# Altium schematic sheet TPS25750D.SchDoc
size A2; Date: Not shown in title block; ApprovedBy: Not shown in title block; CheckedBy: Not shown in title block; Author: Not shown in title block; CompanyName: Not shown in title block; Engineer: Not shown in title block; Organization: Not shown in title block; Address1: Not shown in title block; Address2: Not shown in title block; Address3: Not shown in title block; Address4: Not shown in title block; DocumentNumber: 2; Revision: Use project parameter SCH_Rev; SheetNumber: 2; SheetTotal: 3; PageSetup: Record=PageOptions|CenterHorizontal=True|CenterVertical=True|PrintScale=1.00|XCorrection=1.00|YCorrection=1.00|PrintKind=0|BorderSize=5000000|LeftOffset=0|BottomOffset=0|Orientation=2|PaperLength=1000|PaperWidth=1000|Scale=100|PaperSource=15|PrintQuality=600|MediaType=1|DitherType=10|PaperKind=Letter|PrintScaleMode=1; CurrentTime: Not shown in title block; CurrentDate: Not shown in title block; Time: Not shown in title block; DocumentFullPathAndName: Not shown in title block; DocumentName: Not shown in title block; ModifiedDate: Not shown in title block; ImagePath: Not shown in title block
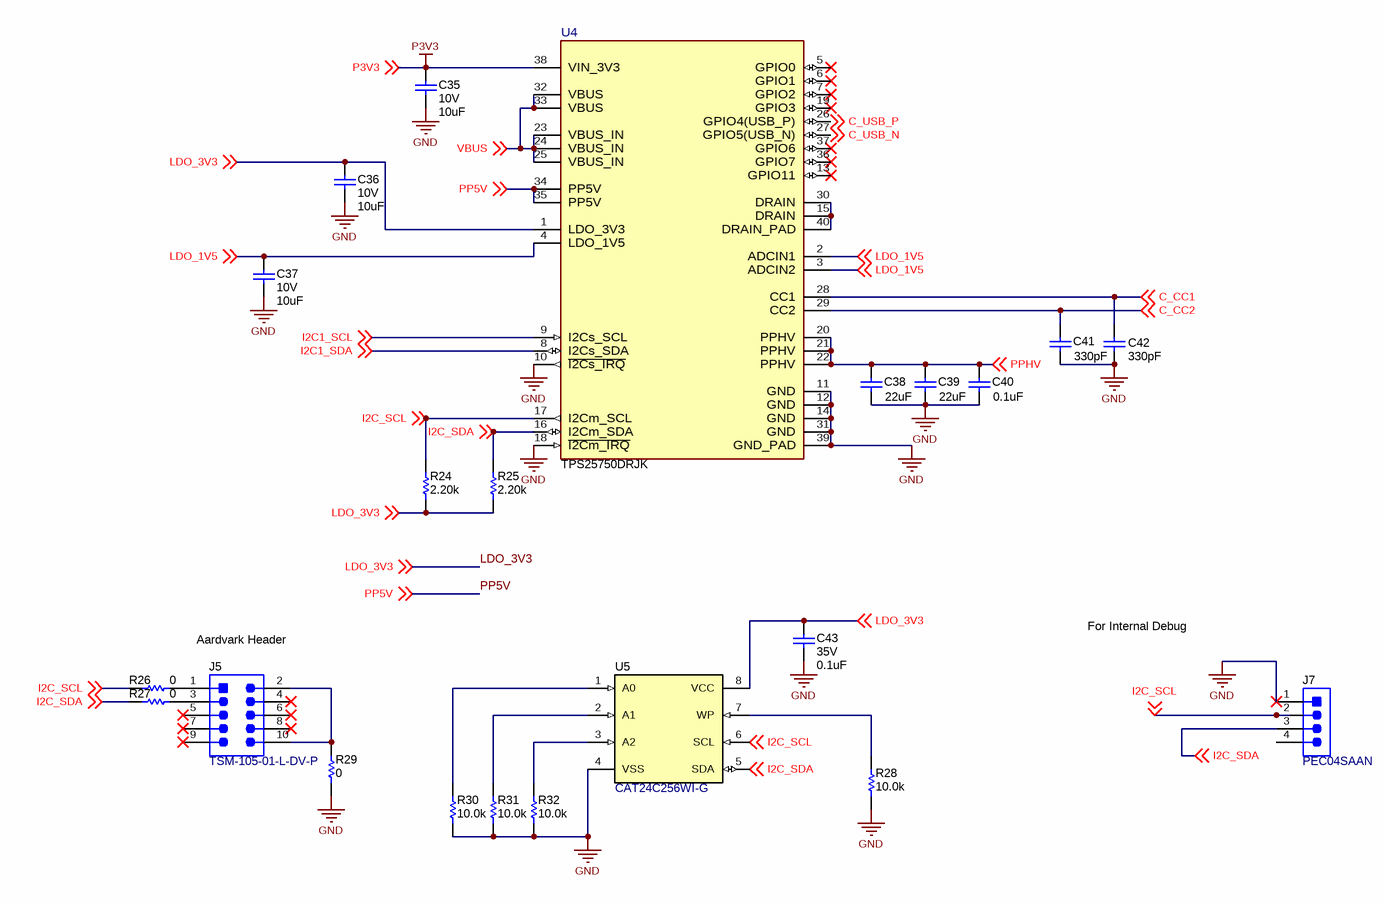
[diagram p0: TPS25750D.SchDoc]

## Parts
C35  VDC_V: 10V  ValueDisplayed: 10uF  [0402_070]  (hidden comment: CL05A106MP5NUNC)
C36  VDC_V: 10V  ValueDisplayed: 10uF  [0402_070]  (hidden comment: CL05A106MP5NUNC)
C37  VDC_V: 10V  ValueDisplayed: 10uF  [0402_070]  (hidden comment: CL05A106MP5NUNC)
C38  ValueDisplayed: 22uF  [0805_HV]  (hidden comment: C2012X5R1V226M125AC)
C39  ValueDisplayed: 22uF  [0805_HV]  (hidden comment: C2012X5R1V226M125AC)
C40  ValueDisplayed: 0.1uF  [0402]  (hidden comment: GMK105BJ104KV-F)
C41  ValueDisplayed: 330pF  [0201_033]  (hidden comment: GRM033R71H331KA12D)
C42  ValueDisplayed: 330pF  [0201_033]  (hidden comment: GRM033R71H331KA12D)
C43  VDC_V: 35V  ValueDisplayed: 0.1uF  [0402]  (hidden comment: GMK105BJ104KV-F)
J5  TSM-105-01-L-DV-P  [Samtec_TSM-105-01-x-DV]
J7  PEC04SAAN  [SULLINS_PEC04SAAN]
R24  ValueDisplayed: 2.20k  [0201]  (hidden comment: CRCW02012K20FKED)
R25  ValueDisplayed: 2.20k  [0201]  (hidden comment: CRCW02012K20FKED)
R26  ValueDisplayed: 0  [0201]  (hidden comment: CRCW02010000Z0ED)
R27  ValueDisplayed: 0  [0201]  (hidden comment: CRCW02010000Z0ED)
R28  ValueDisplayed: 10.0k  [0201]  (hidden comment: CRCW020110K0FKED)
R29  ValueDisplayed: 0  [0201]  (hidden comment: CRCW02010000Z0ED)
R30  ValueDisplayed: 10.0k  [0201]  (hidden comment: CRCW020110K0FKED)
R31  ValueDisplayed: 10.0k  [0201]  (hidden comment: CRCW020110K0FKED)
R32  ValueDisplayed: 10.0k  [0201]  (hidden comment: CRCW020110K0FKED)
U4  TPS25750DRJK  [RJK0038B-C01-MFG]
U5  CAT24C256WI-G  [SOIC-8]

## Nets
GND: C35.2 C36.2 C37.2 C38.2 C39.2 C40.2 C41.2 C42.2 C43.2 J7.1 R28.1 R29.1 R30.1 R31.1 R32.1 U4.10(~{I2Cs_IRQ}) U4.11(GND) U4.12(GND) U4.14(GND) U4.18(~{I2Cm_IRQ}) U4.31(GND) U4.39(GND_PAD) U5.4(VSS)
P3V3: C35.1 U4.38(VIN_3V3) ; off-sheet P3V3
C_CC1: C42.1 U4.28(CC1) ; off-sheet C_CC1
C_CC2: C41.1 U4.29(CC2) ; off-sheet C_CC2
C_USB_N: U4.27(GPIO5(USB_N)) ; off-sheet C_USB_N
C_USB_P: U4.26(GPIO4(USB_P)) ; off-sheet C_USB_P
I2C1_SCL: U4.9(I2Cs_SCL) ; off-sheet I2C1_SCL
I2C1_SDA: U4.8(I2Cs_SDA) ; off-sheet I2C1_SDA
I2C_SCL: J7.2 R24.2 R26.1 U4.17(I2Cm_SCL) U5.6(SCL) ; off-sheet I2C_SCL
I2C_SDA: J7.3 R25.2 R27.1 U4.16(I2Cm_SDA) U5.5(SDA) ; off-sheet I2C_SDA
LDO_1V5: C37.1 U4.2(ADCIN1) U4.3(ADCIN2) U4.4(LDO_1V5) ; off-sheet LDO_1V5
LDO_3V3: C36.1 C43.1 R24.1 R25.1 U4.1(LDO_3V3) U5.8(VCC) ; off-sheet LDO_3V3
PP5V: U4.34(PP5V) U4.35(PP5V) ; off-sheet PP5V
PPHV: C38.1 C39.1 C40.1 U4.20(PPHV) U4.21(PPHV) U4.22(PPHV) ; off-sheet PPHV
VBUS: U4.23(VBUS_IN) U4.24(VBUS_IN) U4.25(VBUS_IN) U4.32(VBUS) U4.33(VBUS) ; off-sheet VBUS
NetJ5_1: J5.1 R26.2
NetJ5_2: J5.2 J5.10 R29.2
NetJ5_3: J5.3 R27.2
NetR28_2: R28.2 U5.7(WP)
NetR30_2: R30.2 U5.1(A0)
NetR31_2: R31.2 U5.2(A1)
NetR32_2: R32.2 U5.3(A2)
NetU4_15: U4.15(DRAIN) U4.30(DRAIN) U4.40(DRAIN_PAD)

Not connected (* = marked no-connect by the designer): J5 4* 5* 6* 7* 8* 9*; J7 4; U4 5(GPIO0)* 6(GPIO1)* 7(GPIO2)* 13(GPIO11)* 19(GPIO3)* 36(GPIO7)* 37(GPIO6)*

## Notes on the sheet
- Aardvark Header
- For Internal Debug
- Orderable:
- Designed for:
- Mod. Date:
- Texas Instruments and/or its licensors do not warrant the accuracy or completeness of this specification or any information contained therein. Texas Instruments and/or its licensors do not warrant that this design will meet the specifications, will be suitable for your application or fit for any particular purpose, or will operate in an implementation. Texas Instruments and/or its licensors do not warrant that the design is production worthy. You should completely validate and test your design implementation to confirm the system functionality for your application.
- Drawn By:
- Engineer:
- SVN Rev:
- Number:
- TID #:
- Rev:
- Sheet Title:
- File:
- Contact:
- Project Title:
- Assembly Variant:
- Sheet:
- Size:
- of
- A2
- © Texas Instruments
- http://www.ti.com

## Library data of the parts
C35-C37 = CMP-0006339-4: CAP, CERM, 10 uF, 10 V, +/- 20%, X5R, 0402; Manufacturer: Samsung Electro-Mechanics; TaMin_C: -55°C; Polarized: N; SizeAreaWB_mm2: 3; Value1: Unknown; U/M: EA; Value: 10uF; TaMax_C: 85°C; SizeZ_mm: 0.6; SizeX_mm: 1; SizeY_mm: 0.5; Cap_Case: 0402; Cap_F: 10µF; AEC Category: Q200; TempCo: X5R; RoHS: Y; MountType: SMT; PackageReference: 0402; Tolerance_%: 20%; Value2: 10V; SizeArea_mm2: 0.5; CompType: Capacitor; PartNumber: CL05A106MP5NUNC; AEC Qualified: N; ComponentLink1Description: Datasheet link; Technology: Ceramic; ComponentLink1URL: http://www.samsungsem.com/kr/support/product-search/mlcc/__icsFiles/afieldfile/2018/06/21/CL05A106MP5NUNC.pdf; AEC Grade: N/A
C38 C39 = CMP-0007844-2: CAP, CERM, 22 uF, 35 V, +/- 20%, X5R, 0805; Manufacturer: TDK; TaMin_C: -55°C; ESR_ohm: 2.05m; Polarized: N; SizeAreaWB_mm2: 6.75; Value1: 0.00205 ohm; U/M: EA; Value: 22uF; TaMax_C: 85°C; SizeZ_mm: 1.45; SizeX_mm: 2; SizeY_mm: 1.25; Cap_Case: 0805; Value2: 35V; SizeArea_mm2: 2.5; Cap_F: 22µF; IRMS_A: 4.55587A; AEC Category: Q200; Publisher: Texas Instruments; TempCo: X5R; Published: 2008-06-19; RoHS: Y; MountType: SMT; Supplier 1: Digi-Key; PackageReference: 0805; Tolerance_%: 20%; CompType: Capacitor; LatestRevisionDate: 2017-03-09; PartNumber: C2012X5R1V226M125AC; AEC Qualified: N; ComponentLink1Description: Datasheet link; AEC Grade: N/A; Supplier Part Number 1: 445-14428-1-ND; Technology: Ceramic; ComponentLink1URL: https://product.tdk.com/en/search/capacitor/ceramic/mlcc/info?part_no=C2012X5R1V226M125AC
C40 = CMP-0006370-2: CAP, CERM, 0.1 uF, 35 V, +/- 10%, X5R, 0402; Manufacturer: Taiyo Yuden; TaMin_C: -55°C; Polarized: N; SizeAreaWB_mm2: 3; Value1: Unknown; U/M: EA; Value: 0.1uF; TaMax_C: 85°C; SizeZ_mm: 0.6; SizeX_mm: 1; SizeY_mm: 0.5; Value2: 35V; Cap_F: 100nF; AEC Category: Q200; Supplier Part Number 2: 84R9117; Publisher: Texas Instruments; Supplier 2: Newark; Supplier Part Number 3: 963-GMK105BJ104KV-F; TempCo: X5R; Supplier 3: Mouser; Published: 2008-06-19; RoHS: Y; MountType: SMT; Supplier 1: Digi-Key; PackageReference: 0402; Tolerance_%: 10%; Cap_Case: 0402; SizeArea_mm2: 0.5; CompType: Capacitor; LatestRevisionDate: 2017-03-09; PartNumber: GMK105BJ104KV-F; AEC Qualified: N; ComponentLink1Description: Datasheet link; AEC Grade: N/A; Supplier Part Number 1: 587-1994-1-ND; Technology: Ceramic; ComponentLink1URL: http://www.yuden.co.jp/productdata/catalog/en/mlcc_all_e.pdf
C41 C42 = CMP-0009779-2: CAP, CERM, 330 pF, 50 V, +/- 10%, X7R, 0201; Manufacturer: MuRata; TaMin_C: -55°C; Polarized: N; SizeAreaWB_mm2: 2.08; Value1: Unknown; U/M: EA; Value: 330pF; TaMax_C: 125°C; SizeZ_mm: 0.33; SizeX_mm: 0.6; SizeY_mm: 0.3; Cap_Case: 0201; Value2: 50V; SizeArea_mm2: 0.18; AEC Category: Q200; Supplier Part Number 2: 81-GRM033R71H331KA2D; Publisher: Texas Instruments; Supplier 2: Mouser; TempCo: X7R; Published: 2008-06-19; RoHS: Y; MountType: SMT; Supplier 1: Digi-Key; PackageReference: 0201; Tolerance_%: 10%; CompType: Capacitor; LatestRevisionDate: 2017-03-09; PartNumber: GRM033R71H331KA12D; AEC Qualified: N; Cap_F: 330pF; ComponentLink1Description: Datasheet link; AEC Grade: N/A; Supplier Part Number 1: GRM033R71H331KA12D-ND; Technology: Ceramic; ComponentLink1URL: http://psearch.en.murata.com/capacitor/product/GRM033R71H331KA12%23.pdf
C43 = CMP-0006370-2: CAP, CERM, 0.1 uF, 35 V, +/- 10%, X5R, 0402; Manufacturer: Taiyo Yuden; TaMin_C: -55°C; Polarized: N; SizeAreaWB_mm2: 3; Value1: Unknown; U/M: EA; Value: 0.1uF; TaMax_C: 85°C; SizeZ_mm: 0.6; SizeX_mm: 1; SizeY_mm: 0.5; Cap_F: 100nF; AEC Category: Q200; Supplier Part Number 2: 84R9117; Publisher: Texas Instruments; Supplier 2: Newark; Supplier Part Number 3: 963-GMK105BJ104KV-F; TempCo: X5R; Supplier 3: Mouser; Published: 2008-06-19; RoHS: Y; MountType: SMT; Supplier 1: Digi-Key; PackageReference: 0402; Tolerance_%: 10%; Cap_Case: 0402; Value2: 35V; SizeArea_mm2: 0.5; CompType: Capacitor; LatestRevisionDate: 2017-03-09; PartNumber: GMK105BJ104KV-F; AEC Qualified: N; ComponentLink1Description: Datasheet link; AEC Grade: N/A; Supplier Part Number 1: 587-1994-1-ND; Technology: Ceramic; ComponentLink1URL: http://www.yuden.co.jp/productdata/catalog/en/mlcc_all_e.pdf
J5 = CMP-0055598-2: Header, 2.54mm, 5x2, Gold, SMT; Manufacturer: Samtec; Current_A: 5.4A; Green_Lifecycle: Active; Shrouded: N; Gender: Male; Cert_CSA: Y; Green_REACh: Passed; Voltage_V: 475V; Row_Count: 2; RowSpacing_mm: 2.54; ComponentLink1URL: https://www.samtec.com/ftppub/cpdf/TSM-1XX-XX-XXX-XX-X-XXX-X-MKT.pdf; ClassName: Header; Supplier Part Number 2: 45P5170; Supplier 2: Newark; Supplier Part Number 3: 2417021; Color: Black; Supplier 3: Farnell; RoHS: Y; MountType: SMT; Green_EU RoHS-2: Passed; Supplier 1: Digi-Key; Green_EU RoHS: Passed; PackageReference: Header, 2.54mm, 5x2, SMT; PinCount: 10; CompType: Header; PartNumber: TSM-105-01-L-DV-P; Orientation: Vertical; ComponentLink1Description: Datasheet URL; Supplier Part Number 1: SAM8741-ND; Pitch_mm: 2.54; ContactFinish: Gold; Cert_UL: Y
J7 = CMP-0054562-1: Header, 100mil, 4x1, Tin, TH; Manufacturer: Sullins Connector Solutions; CNHeader: TRUE; Current_A: 3A; Green_Lifecycle: Not Set; Shrouded: N; Gender: Male; Green_REACh: Incomplete; Voltage_V: 1.8kV; Row_Count: 1; Pitch_mm: 2.54; CT: FALSE; Cert_UL: Y; ComponentLink1URL: http://www.sullinscorp.com/catalogs/77_PAGE108-109_.100_MALE_HDR.pdf; ClassName: Header; Publisher: Texas Instruments; Color: Black; RoHS: Y; MountType: TH; Green_EU RoHS-2: Incomplete; Supplier 1: Digi-Key; Green_EU RoHS: Incomplete; PackageReference: Header, 4x1, 100mil, TH; PinCount: 4; CompType: Header; LatestRevisionDate: 26/05/2017; PartNumber: PEC04SAAN; Orientation: Vertical; ComponentLink1Description: Datasheet URL; Supplier Part Number 1: S1012E-04-ND; ContactFinish: Tin
R24 R25 = CMP-0027272-3: RES, 2.20 k, 1%, 0.05 W, 0201; Manufacturer: Vishay-Dale; Power_W: 50mW; TempCo: 100 ppm/C; Value_Code: 2k20; Value: 2.20k; Res_ohm: 2.2k; SizeX_mm: 0.6; SizeY_mm: 0.3; SizeZ_mm: 0.26; Value2: 0.05W; SizeArea_mm2: 0.18; AEC Qualified: N; VDC_V: 30V; AEC Category: Q200; Supplier Part Number 2: 01X1849; Supplier 2: Newark; Supplier Part Number 3: 71-CRCW02012K20FKED; Supplier 3: Mouser; RoHS: E; Value1: 1%; MountType: SMT; Supplier 1: Digi-Key; PackageReference: 0201; Tolerance_%: 1%; CompType: Resistor; PartNumber: CRCW02012K20FKED; ComponentLink1Description: Datasheet link; AEC Grade: N/A; Supplier Part Number 1: 541-2.20KAABCT-ND; Technology: Thick Film; ComponentLink1URL: http://www.vishay.com/docs/20052/crcw0201e3.pdf
R26 R27 R29 = CMP-0027008-4: RES, 0, 5%, 0.05 W, 0201; Manufacturer: Vishay-Dale; Power_W: 50mW; TempCo: ppm/C; Value_Code: 0000; Value: 0; EIA_Code: E24; SizeX_mm: 0.6; SizeY_mm: 0.3; SizeZ_mm: 0.26; Value2: 0.05W; SizeArea_mm2: 0.18; AEC Qualified: N; AEC Category: Q200; RoHS: E; Value1: 5%; MountType: SMT; Supplier 1: Newark; PackageReference: 0201; Tolerance_%: 5%; Res_ohm: 0; CompType: Resistor; PartNumber: CRCW02010000Z0ED; ComponentLink1Description: Datasheet link; AEC Grade: N/A; Supplier Part Number 1: 72M6743; Technology: Thick Film; ComponentLink1URL: http://www.vishay.com/docs/20052/crcw0201e3.pdf
R28 R30-R32 = CMP-0027262-3: RES, 10.0 k, 1%, 0.05 W, 0201; Manufacturer: Vishay-Dale; Power_W: 50mW; TempCo: 100 ppm/C; Value_Code: 10k0; Value: 10.0k; EIA_Code: E96; Res_ohm: 10k; SizeX_mm: 0.6; SizeY_mm: 0.3; SizeZ_mm: 0.26; Value2: 0.05W; SizeArea_mm2: 0.18; AEC Qualified: N; VDC_V: 30V; AEC Category: Q200; Supplier Part Number 2: 71R4422; Supplier 2: Newark; Supplier Part Number 3: 71-CRCW020110K0FKED; Supplier 3: Mouser; RoHS: E; Value1: 1%; MountType: SMT; Supplier 1: Digi-Key; PackageReference: 0201; Tolerance_%: 1%; CompType: Resistor; PartNumber: CRCW020110K0FKED; ComponentLink1Description: Datasheet link; AEC Grade: N/A; Supplier Part Number 1: 541-10.0KAABCT-ND; Technology: Thick Film; ComponentLink1URL: http://www.vishay.com/docs/20052/crcw0201e3.pdf
U4 = CMP-0090338-5: USB Type-C and USB PD Controller with Integrated Power Switches Optimized for Power Applications; Manufacturer: Texas Instruments; CompType: IC; Usb Standard: USB 3.0; AEC Category: Q200; SizeZ_mm: 0.8mm; Standoff Height: 0mm; AEC Qualified: No; Max Supply Voltage: 22V; TaMax_C: +105°C; Min Supply Voltage: 3V; TaMin_C: -40°C; TJmax_C: +175°C; Number Of Ports: 1; RoHS: UNKNOWN; Part Number: TPS25750DRJK; ComponentLink3URL: http://www.ti.com/product/GPN/datasheet; helpURL: https://upverter.com/upn/revision/5be88369cac593dc/; ComponentLink1URL: http://www.ti.com/lit/ds/symlink/GPN.pdf; PartNumber: TPS25750DRJK; PackageReference: VQFN32; ComponentLink1Description: Datasheet Link; ComponentLink2URL: http://www.ti.com/product/GPN; Operating Temperature Range: -40°C to +125°C; Datasheet Path: datasheets/IC-TPS25750DRJK.pdf; ComponentLink2Description: Product Folder; ComponentLink3Description: Online Datasheet
U5 = CMP-0005314-2: 256 kb I2C CMOS Serial EEPROM, SOIC-8; Manufacturer: ON Semiconductor; SizeAreaWB_mm2: 55.131; SizeZ_mm: 1.75; SizeX_mm: 5.99; SizeY_mm: 4.9; SizeArea_mm2: 29.351; Supplier Part Number 2: 06R0552; Publisher: Texas Instruments; Supplier 2: Newark; Supplier Part Number 3: 698-CAT24C256WI-G; Supplier 3: Mouser; RoHS: Y; MountType: SMT; Supplier 1: Digi-Key; PackageReference: SOIC-8; LatestRevisionDate: 09/03/2017; PartNumber: CAT24C256WI-G; ComponentLink1Description: Datasheet URL; Supplier Part Number 1: CAT24C256WI-G-ND; ComponentLink1URL: http://www.onsemi.com/pub_link/Collateral/CAT24C256-D.PDF